# EasyEDA Pro project ProPrj_STM32SmartWatch.epro

# Schematic Schematic1
Board Name: Board1; Create Date: 2026-09-27; Page Name: P1; Project Name: STM32SmartWatch_2026-09-27_17-07-18; Schematic Name: Schematic1; Update Date: 2026-10-04; Company: 嘉立创EDA; Page Size: A4; Version: V1.0
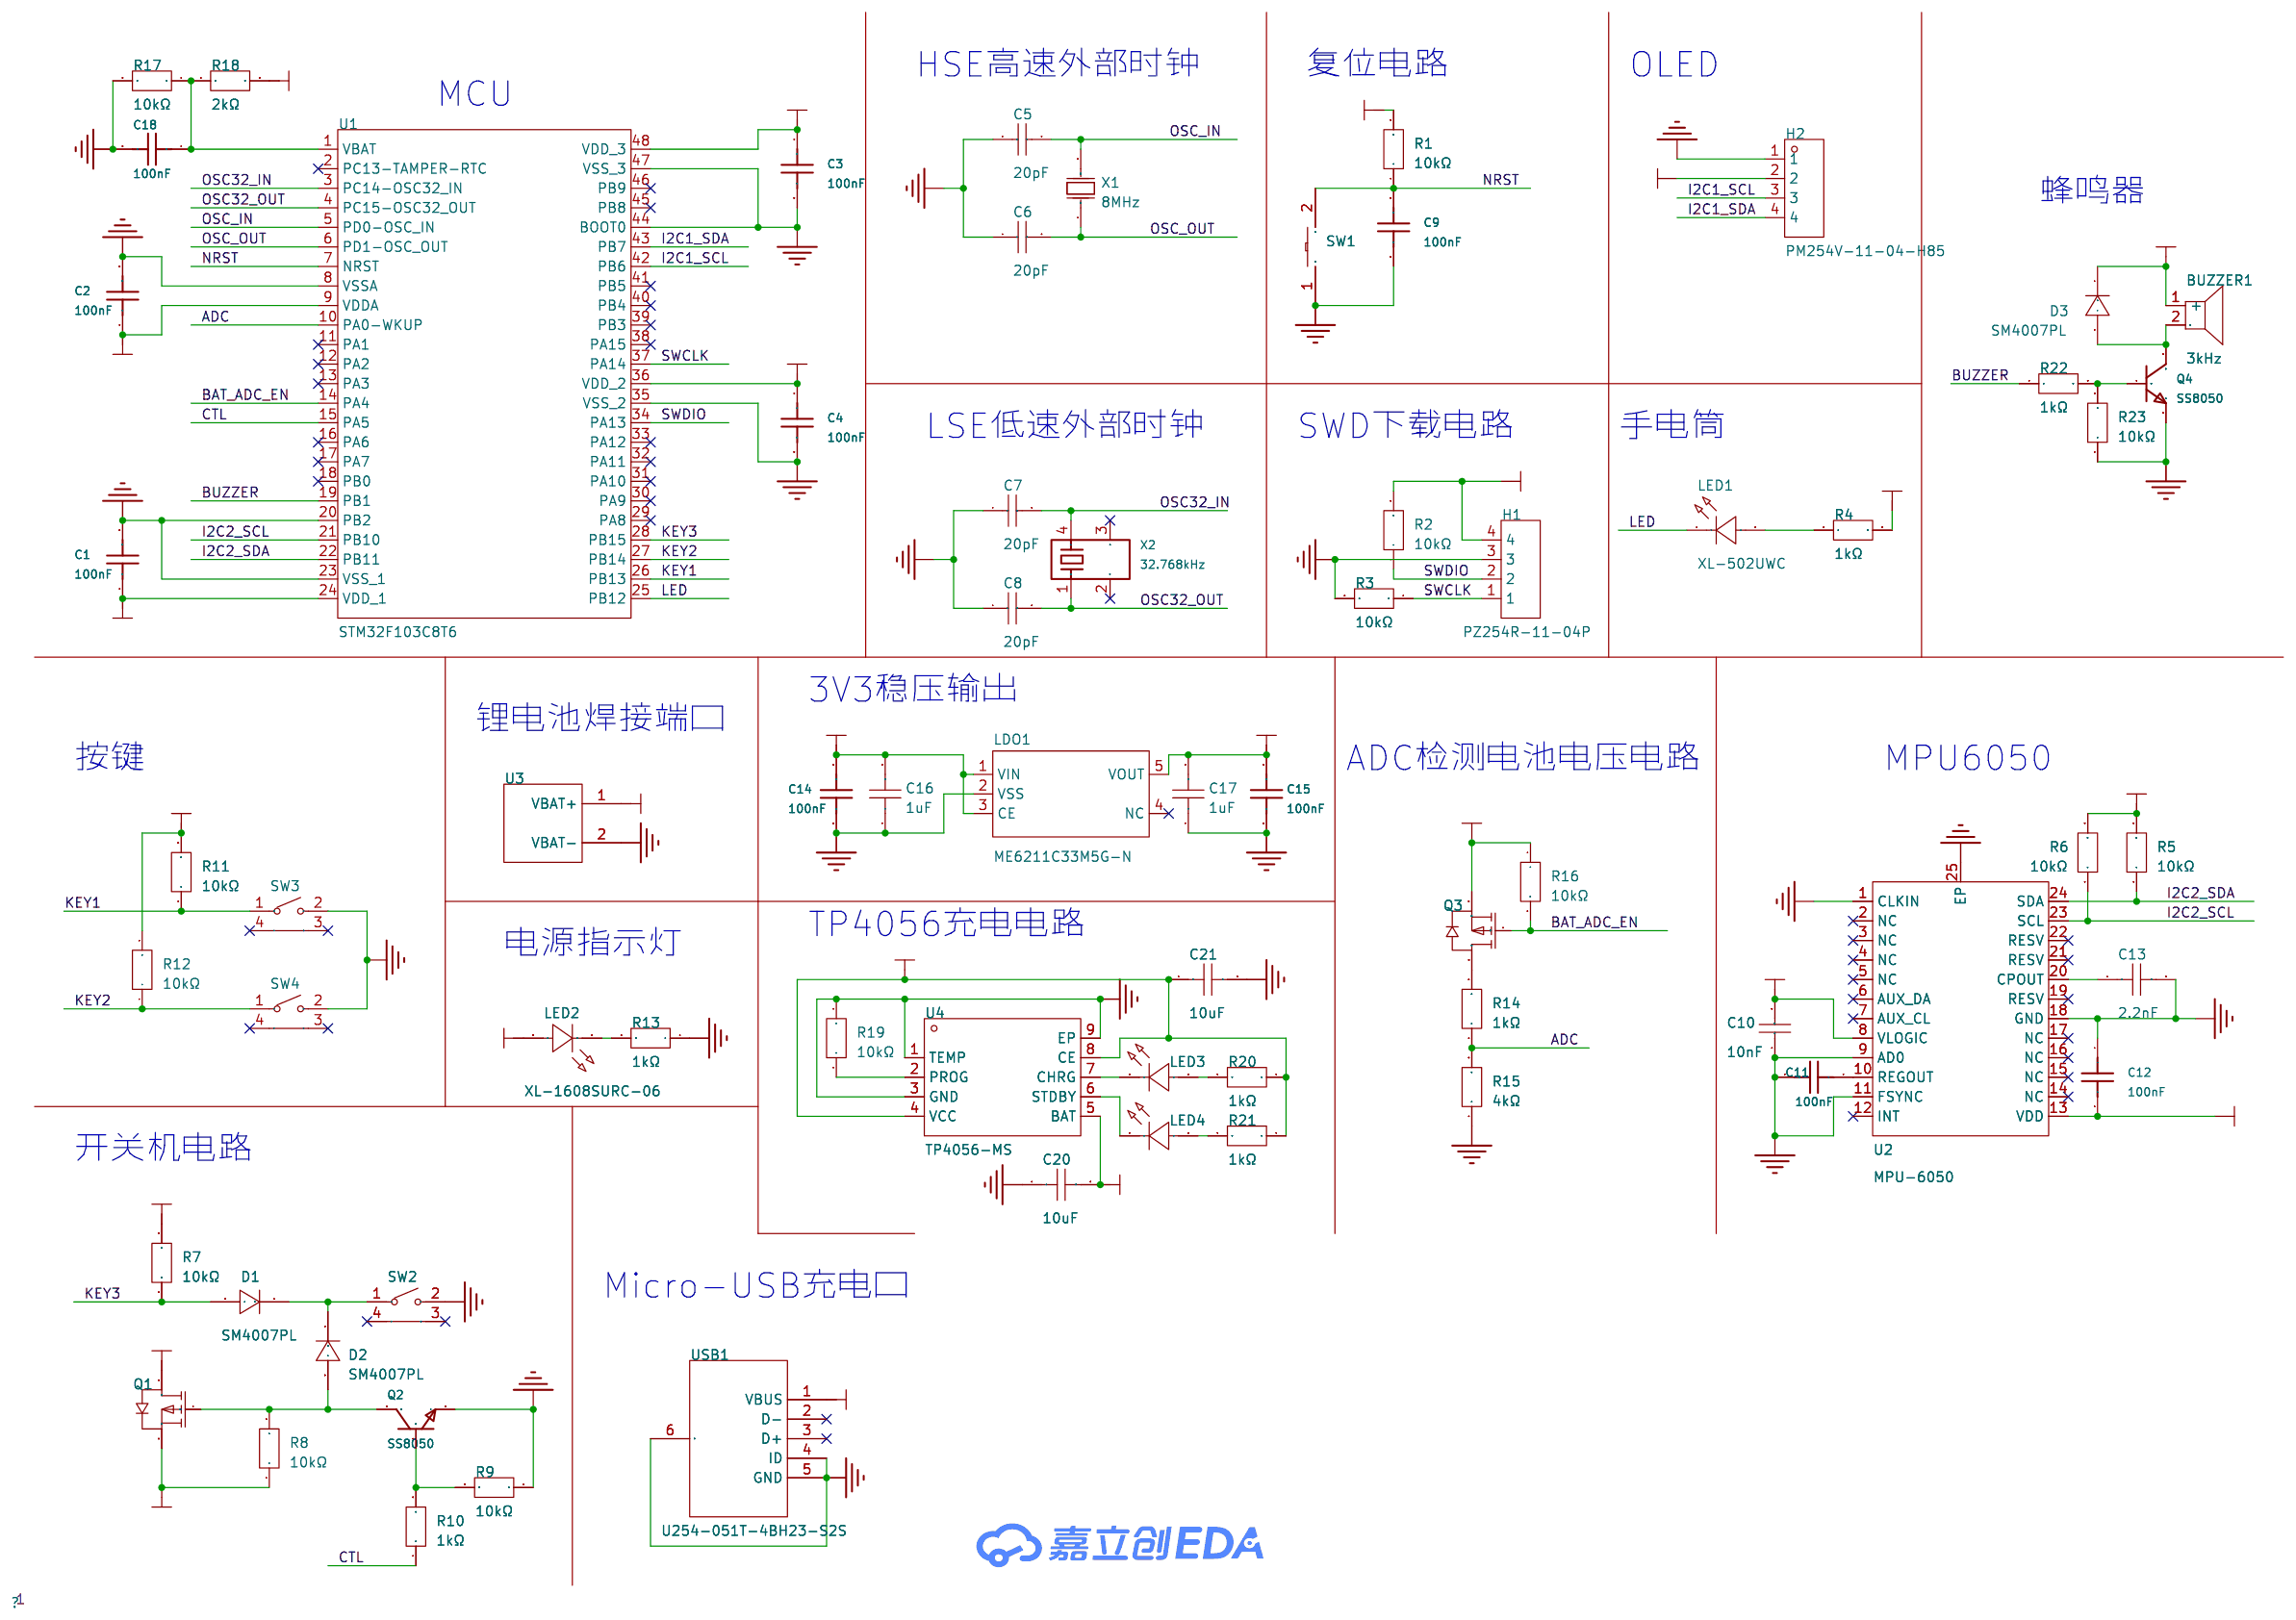
[diagram p0: schematic sheet]

## Parts
BUZZER1  3kHz  [BUZ-TH_BD9.6-P5.00-D0.7-FD]
C1  100nF  [C0603]
C2  100nF  [C0603]
C3  100nF  [C0603]
C4  100nF  [C0603]
C5  20pF  [C0603]
C6  20pF  [C0603]
C7  20pF  [C0603]
C8  20pF  [C0603]
C9  100nF  [C0603]
C10  10nF  [C0603]
C11  100nF  [C0603]
C12  100nF  [C0603]
C13  2.2nF  [C0603]
C14  100nF  [C0603]
C15  100nF  [C0603]
C16  1uF  [C0603]
C17  1uF  [C0603]
C18  100nF  [C0603]
C20  10uF  [C0603]
C21  10uF  [C0603]
D1  SM4007PL  [SOD-123F_L2.8-W1.8-LS3.7-RD]
D2  SM4007PL  [SOD-123F_L2.8-W1.8-LS3.7-RD]
D3  SM4007PL  [SOD-123F_L2.8-W1.8-LS3.7-RD]
H1  PZ254R-11-04P  [HDR-TH_4P-P2.54-H-M-W10.4]
H2  PM254V-11-04-H85  [HDR-TH_4P-P2.54-V-F]
LDO1  ME6211C33M5G-N  [SOT-23-5_L3.0-W1.7-P0.95-LS2.8-BL]
LED1  XL-502UWC  [LED-TH_BD5.9-P2.54-RD_WHITE]
LED2  XL-1608SURC-06  [LED0603-RD_RED]
LED3  XL-1608SURC-06  [LED0603-RD_RED]
LED4  XL-1608PGC-06  [LED0603-RD_GREEN]
Q1  SI2301CDS-T1-GE3  [SOT-23-3_L3.0-W1.7-P0.95-LS2.9-BR]
Q2  SS8050  [SOT-23-3_L2.9-W1.3-P1.90-LS2.4-BR]
Q3  SI2301CDS-T1-GE3  [SOT-23-3_L3.0-W1.7-P0.95-LS2.9-BR]
Q4  SS8050  [SOT-23-3_L2.9-W1.3-P1.90-LS2.4-BR]
R1  10kΩ  [R0603]
R2  10kΩ  [R0603]
R3  10kΩ  [R0603]
R4  1kΩ  [R0603]
R5  10kΩ  [R0603]
R6  10kΩ  [R0603]
R7  10kΩ  [R0603]
R8  10kΩ  [R0603]
R9  10kΩ  [R0603]
R10  1kΩ  [R0603]
R11  10kΩ  [R0603]
R12  10kΩ  [R0603]
R13  1kΩ  [R0603]
R14  1kΩ  [R0603]
R15  4kΩ  [R0603]
R16  10kΩ  [R0603]
R17  10kΩ  [R0603]
R18  2kΩ  [R0603]
R19  10kΩ  [R0603]
R20  1kΩ  [R0603]
R21  1kΩ  [R0603]
R22  1kΩ  [R0603]
R23  10kΩ  [R0603]
SW1  TS-1101-C-W  [SW-SMD_L6.0-W3.3-LS8.0_TS-1101-C-W]
SW2  GT-TC018A-H0375-L1  [SW-SMD_L4.7-W3.5-P3.35-EH]
SW3  GT-TC018A-H0375-L1  [SW-SMD_L4.7-W3.5-P3.35-EH]
SW4  GT-TC018A-H0375-L1  [SW-SMD_L4.7-W3.5-P3.35-EH]
U1  STM32F103C8T6  [LQFP-48_L7.0-W7.0-P0.50-LS9.0-BL]
U2  MPU-6050  [QFN-24_L4.0-W4.0-P0.50-BL-EP2.7]
U3  -  [302530BAT]
U4  TP4056-MS  [SOP-8_L4.9-W3.9-P1.27-LS6.0-TL-EP]
USB1  U254-051T-4BH23-S2S  [MICRO-USB-SMD_U254-051T-4BH23-S2S]
X1  8MHz  [CRYSTAL-SMD_L5.0-W3.2]
X2  32.768kHz  [MC-306_4P-L8.0-W3.2-P5.5-BL]

## Library data of the parts
BUZZER1 = HNB09A05: 驱动方式:有源(内含驱动线路);构造类型:电磁式;额定电压:5V;频率:3kHz;声压(SPL):85dB;; LCSC Part Name: 有源(内含驱动线路) 电磁式 3kHz; Supplier Part: C96493; Manufacturer: 华能; Supplier Footprint: 插件,D=9mm; JLCPCB Part Class: 扩展库; Datasheet: https://item.szlcsc.com/datasheet/HNB09A05/97698.html; Supplier: LCSC; Driver Circuitry: 有源(内含驱动线路); Technology: 电磁式; Voltage Rating: 5V; Voltage - Supply: 3V~7V; Current Consumption: 30mA; Sound Pressure Level(SPL): 85dB; Diameter(φD): 9mm; Height: 5.7mm; Operating Temperature: -20℃~+70℃; Mounting Type: 插件
C1-C4 C9 C11 C12 C14 C15 C18 = CC0603KRX7R9BB104: 容值:100nF;精度:±10%;额定电压:50V;温度系数:X7R;; LCSC Part Name: 100nF ±10% 50V; Supplier Part: C14663; Manufacturer: YAGEO(国巨); Supplier Footprint: 0603; JLCPCB Part Class: 基础库; Datasheet: https://item.szlcsc.com/datasheet/CC0603KRX7R9BB104/15331.html; Supplier: LCSC; Tolerance: ±10%; Voltage Rating: 50V; Temperature Coefficient: X7R
C5-C8 = CL10C200JB8NNNC: 容值:20pF;精度:±5%;额定电压:50V;温度系数:C0G;; LCSC Part Name: 20pF ±5% 50V; Supplier Part: C1648; Manufacturer: SAMSUNG(三星); Supplier Footprint: 0603; JLCPCB Part Class: 基础库; Datasheet: https://item.szlcsc.com/datasheet/CL10C200JB8NNNC/2000.html; Supplier: LCSC; Tolerance: ±5%; Voltage Rating: 50V; Temperature Coefficient: C0G
C10 = CC0603KRX7R9BB103: 容值:10nF;精度:±10%;额定电压:50V;温度系数:X7R;; LCSC Part Name: 10nF ±10% 50V; Supplier Part: C100042; Manufacturer: YAGEO(国巨); Supplier Footprint: 0603; JLCPCB Part Class: 扩展库; Datasheet: https://item.szlcsc.com/datasheet/CC0603KRX7R9BB103/101256.html; Supplier: LCSC; Tolerance: ±10%; Voltage Rating: 50V; Temperature Coefficient: X7R
C13 = FCC0603B222K500CT: 容值:2.2nF;精度:±10%;额定电压:50V;温度系数:X7R;; LCSC Part Name: 2.2nF ±10% 50V; Supplier Part: C5137562; Manufacturer: FOJAN(富捷); Supplier Footprint: 0603; JLCPCB Part Class: 扩展库; Datasheet: https://item.szlcsc.com/datasheet/FCC0603B222K500CT/5747014.html; Supplier: LCSC; Tolerance: ±10%; Voltage Rating: 50V; Temperature Coefficient: X7R; Operating Temperature: -55℃~+125℃
C16 C17 = CL10A105KB8NNNC: 容值:1uF;精度:±10%;额定电压:50V;温度系数:X5R;; LCSC Part Name: 1uF ±10% 50V; Supplier Part: C15849; Manufacturer: SAMSUNG(三星); Supplier Footprint: 0603; JLCPCB Part Class: 基础库; Datasheet: https://item.szlcsc.com/datasheet/CL10A105KB8NNNC/16531.html; Supplier: LCSC; Tolerance: ±10%; Voltage Rating: 50V; Temperature Coefficient: X5R
C20 C21 = CL10A106KP8NNNC: 容值:10uF;精度:±10%;额定电压:10V;温度系数:X5R;; LCSC Part Name: 10uF ±10% 10V; Supplier Part: C19702; Manufacturer: SAMSUNG(三星); Supplier Footprint: 0603; JLCPCB Part Class: 基础库; Datasheet: https://item.szlcsc.com/datasheet/CL10A106KP8NNNC/20411.html; Supplier: LCSC; Tolerance: ±10%; Voltage Rating: 10V; Temperature Coefficient: X5R
D1-D3 = SM4007PL_C64898: 二极管配置:独立式;正向压降(Vf):1.1V@1A;直流反向耐压(Vr):1kV;整流电流:1A;; LCSC Part Name: 1kV 1A; Supplier Part: C64898; Manufacturer: MDD(辰达半导体); Supplier Footprint: SOD-123FL; JLCPCB Part Class: 基础库; Datasheet: https://item.szlcsc.com/datasheet/SM4007PL/65968.html; Supplier: LCSC; Diode Configuration: 独立式; Voltage - Forward(Vf@If): 1.1V@1A; Voltage - DC Reverse(Vr): 1kV; Current - Rectified: 1A; Reverse Leakage Current (Ir): 10uA@1kV; Non-Repetitive Peak Forward Surge Current: 25A; Operating Junction Temperature Range: -55℃~+150℃
H1 = PZ254R-11-04P: 插针结构:1x4P;间距:2.54mm;行距:-;圆针/方针:方针;安装方式:弯插;排数:单排;总PIN位数:4P;额定电流:3A;额定电压:250V;配合针长度:6mm;塑高:2.5mm;端接针长度:-;触头材质:黄铜;触头镀层:-;工作温度:-40℃~+105℃;颜色:黑色;; LCSC Part Name: 1x4P 间距:2.54mm 方针 弯插; Supplier Part: C492412; Manufacturer: XFCN(兴飞); Supplier Footprint: 弯插,P=2.54mm; JLCPCB Part Class: 扩展库; Datasheet: https://item.szlcsc.com/datasheet/PZ254R-11-04P/502968.html; Supplier: LCSC; Pin Structure: 1x4P; Pitch: 2.54mm; Circluar Pins/Square Pins: 方针; Mounting Type: 弯插; Number of Rows: 单排; Number of Pins: 4P; Current Rating: 3A; Voltage Rating (Max): 250V; Length of Mating Pin: 6mm; Insulation Height: 2.5mm; Contact Material: 黄铜; Operating Temperature: -40℃~+105℃; Color: 黑色
H2 = PM254V-11-04-H85: 插孔结构:1x4P;间距:2.54mm;行距:-;圆孔/方孔:方孔;安装方式:直插;排数:单排;总孔位数:4P;额定电流:3A;额定电压:250V;插孔方向:顶部;塑高:8.5mm;触头材质:黄铜;触头镀层:金;工作温度:-40℃~+105℃;; LCSC Part Name: 1x4P 间距:2.54mm 直插; Supplier Part: C541851; Manufacturer: XFCN(兴飞); Supplier Footprint: 插件,P=2.54mm; JLCPCB Part Class: 扩展库; Datasheet: https://item.szlcsc.com/datasheet/PM254V-11-04-H85/562472.html; Supplier: LCSC; Holes Structure: 1x4P; Pitch: 2.54mm; Circular Hole / Square Hole: 方孔; Mounting Type: 直插; Number of Rows: 单排; Number of Positions: 4P; Current Rating: 3A; Voltage Rating (Max): 250V; Holes Direction: 顶部; Insulation Height: 8.5mm; Contact Material: 黄铜; Contact Plating: 金; Operating Temperature: -40℃~+105℃; PIN Length: 3.2mm
LDO1 = ME6211C33M5G-N: 输出极性:正极;工作电压:6V;输出电压:3.3V;输出电流:500mA;电源纹波抑制比(PSRR):70dB@(1kHz);输出类型:固定;; LCSC Part Name: 3.3V 500mA 6V; Supplier Part: C82942; Manufacturer: MICRONE(南京微盟); Supplier Footprint: SOT-23-5; JLCPCB Part Class: 扩展库; Datasheet: https://item.szlcsc.com/datasheet/ME6211C33M5G-N/84106.html; Supplier: LCSC; Output Configuration: 正极; Voltage - Supply: 6V; Output Voltage: 3.3V; Output Current: 500mA; Power Supply Rejection Ratio (PSRR): 70dB@(1kHz); Voltage Dropout: 120mV@(100mA); standby current: 60uA; Noise: 50uVrms; Features: 使能控制；短路保护；过流保护; Operating Temperature: -40℃~+150℃; Output Type: 固定; Number of Outputs: 1
LED1 = XL-502UWC: 灯头类型:5mm圆形灯头;发光颜色:白色;正向压降(Vf):3.3V;功率:70mW;测试电流:20mA;波长:-;二极管配置:独立二极管;透镜颜色:无色透明透镜;色温:9000K~20000K;发光强度:20cd;发光角度:30°;载带方式:-;工作温度:-25℃~+85℃;; LCSC Part Name: F5白发白短脚; Supplier Part: C2895480; Manufacturer: XINGLIGHT(成兴光); Supplier Footprint: 插件,D=5mm; JLCPCB Part Class: 扩展库; Datasheet: https://item.szlcsc.com/datasheet/XL-502UWC/3136195.html; Supplier: LCSC; Lamp Holder Type: 5mm圆形灯头; Illumination Color: 白色; Voltage - Forward(Vf): 3.3V; Power(Watts): 70mW; Test Current: 20mA; Diode Configuration: 独立二极管; Lens Color: 无色透明透镜; Color Temperature: 9000K~20000K; Luminous Intensity: 20cd; Viewing Angle: 30°; Operating Temperature: -25℃~+85℃
LED2 LED3 = XL-1608SURC-06: 灯头类型:1.6mmx0.8mm方形灯头;发光颜色:红色;正向压降(Vf):2.3V;功率:50mW;正向电流:20mA;波长:620nm~630nm;二极管配置:独立二极管;透镜颜色:无色透明透镜;色温:-;发光强度:225mcd;发光角度:120°;载带方式:正贴;工作温度:-40℃~+85℃;; LCSC Part Name: 0603红色贴片式发光二极管; Supplier Part: C965799; Manufacturer: XINGLIGHT(成兴光); Supplier Footprint: 0603; JLCPCB Part Class: 扩展库; Datasheet: https://item.szlcsc.com/datasheet/XL-1608SURC-06/1051408.html; Supplier: LCSC; Lamp Holder Type: 1.6mmx0.8mm方形灯头; Illumination Color: 红色; Voltage - Forward(Vf): 2.3V; Power(Watts): 50mW; Forward Current: 20mA; Wavelength - Dominant: 620nm~630nm; Peak Wavelength: 625nm; Diode Configuration: 独立二极管; Lens Color: 无色透明透镜; Luminous Intensity: 225mcd; Viewing Angle: 120°; Mounting Style: 正贴; Operating Temperature: -40℃~+85℃
LED4 = XL-1608PGC-06: 灯头类型:1.6mmx0.8mm方形灯头;发光颜色:翠绿色;正向压降(Vf):2.6V~3V;功率:75mW;正向电流:30mA;波长:515nm~530nm;二极管配置:独立二极管;透镜颜色:绿色透镜;色温:-;发光强度:900mcd;发光角度:120°;载带方式:正贴;工作温度:-20℃~+85℃;; LCSC Part Name: 0603加粉翠绿0.6T贴片式发光二极管; Supplier Part: C7371905; Manufacturer: XINGLIGHT(成兴光); Supplier Footprint: 0603; JLCPCB Part Class: 扩展库; Datasheet: https://item.szlcsc.com/datasheet/XL-1608PGC-06/8342977.html; Supplier: LCSC; Lamp Holder Type: 1.6mmx0.8mm方形灯头; Illumination Color: 翠绿色; Voltage - Forward(Vf): 2.6V~3V; Power(Watts): 75mW; Forward Current: 30mA; Wavelength - Dominant: 515nm~530nm; Peak Wavelength: 525nm; Diode Configuration: 独立二极管; Lens Color: 绿色透镜; Luminous Intensity: 900mcd; Viewing Angle: 120°; Mounting Style: 正贴; Operating Temperature: -20℃~+85℃
Q1 Q3 = SI2301CDS-T1-GE3: 数量:1个P沟道;漏源电压(Vdss):20V;连续漏极电流(Id):3.1A;导通电阻(RDS(on)):142mΩ@2.5V;耗散功率(Pd):1.6W;阈值电压(Vgs(th)):1V;; LCSC Part Name: 1个P沟道 耐压:20V 电流:3.1A; Supplier Part: C10487; Manufacturer: VISHAY(威世); Supplier Footprint: SOT-23; JLCPCB Part Class: 基础库; Datasheet: https://item.szlcsc.com/datasheet/SI2301CDS-T1-GE3/11030.html; Supplier: LCSC; Number: 1个P沟道; Drain to Source Voltage: 20V; Current - Continuous Drain(Id): 3.1A; RDS(on): 142mΩ@2.5V; Pd - Power Dissipation: 1.6W; Gate Threshold Voltage (Vgs(th)): 1V; Gate Charge(Qg): 10nC@4.5V; Input Capacitance(Ciss): 405pF; Reverse Transfer Capacitance (Crss@Vds): 55pF; Operating Temperature: -55℃~+150℃; Type: P沟道; Output Capacitance(Coss): 75pF; Vgs: ±8V
Q2 Q4 = SS8050_C7420370: 晶体管类型:NPN;集电极电流(Ic):1.5A;集射极击穿电压(Vceo):25V;耗散功率(Pd):300mW;直流电流增益(hFE):120;; LCSC Part Name: H档 200-350 NPN 电流:1.5A 电压:25V; Supplier Part: C7420370; Manufacturer: R+O(宏嘉诚); Supplier Footprint: SOT-23; JLCPCB Part Class: 扩展库; Datasheet: https://item.szlcsc.com/datasheet/SS8050/8397192.html; Supplier: LCSC; type: NPN; Current - Collector(Ic): 1.5A; Collector - Emitter Voltage VCEO: 25V; Pd - Power Dissipation: 300mW; DC Current Gain: 120; Transition frequency(fT): 100MHz; Current - Collector Cutoff: 100nA; Vce Saturation(VCE(sat)): 500mV; Operating Temperature: -55℃~+150℃; Emitter-Base Voltage(Vebo): 5V; Number: 1个NPN; Configuration: 独立式
R1-R3 R5-R9 R11 R12 R16 R17 R19 R23 = FRC0603J103 TS: 电阻类型:厚膜电阻;阻值:10kΩ;精度:±5%;功率:100mW;工作电压:75V;温度系数:±100ppm/℃;; LCSC Part Name: 10kΩ ±5% 100mW 厚膜电阻; Supplier Part: C2930027; Manufacturer: FOJAN(富捷); Supplier Footprint: 0603; JLCPCB Part Class: 扩展库; Datasheet: https://item.szlcsc.com/datasheet/FRC0603J103%2520TS/3266960.html; Supplier: LCSC; Type: 厚膜电阻; Tolerance: ±5%; Power(Watts): 100mW; Voltage-Supply(Max): 75V; Temperature Coefficient: ±100ppm/℃; Operating Temperature: -55℃~+155℃
R4 R10 R13 R14 R20-R22 = FRC0603F1001TS: 电阻类型:厚膜电阻;阻值:1kΩ;精度:±1%;功率:100mW;工作电压:75V;温度系数:±100ppm/℃;; LCSC Part Name: 1kΩ ±1% 100mW 厚膜电阻; Supplier Part: C2907002; Manufacturer: FOJAN(富捷); Supplier Footprint: 0603; JLCPCB Part Class: 扩展库; Datasheet: https://item.szlcsc.com/datasheet/FRC0603F1001TS/3180515.html; Supplier: LCSC; Type: 厚膜电阻; Tolerance: ±1%; Power(Watts): 100mW; Voltage-Supply(Max): 75V; Temperature Coefficient: ±100ppm/℃; Operating Temperature: -55℃~+155℃
R15 = ARG03FTC4001N: 电阻类型:薄膜电阻;阻值:4kΩ;精度:±1%;功率:100mW;工作电压:75V;温度系数:±25ppm/℃;; LCSC Part Name: 薄膜电阻 4kΩ ±1% 100mW; Supplier Part: C2984443; Manufacturer: Viking(光颉); Supplier Footprint: 0603; JLCPCB Part Class: 扩展库; Datasheet: https://item.szlcsc.com/datasheet/ARG03FTC4001N/3425978.html; Supplier: LCSC; Type: 薄膜电阻; Tolerance: ±1%; Power(Watts): 100mW; Voltage-Supply(Max): 75V; Temperature Coefficient: ±25ppm/℃; Operating Temperature: -55℃~+155℃
R18 = FRC0603J202 TS: 电阻类型:厚膜电阻;阻值:2kΩ;精度:±5%;功率:100mW;工作电压:75V;温度系数:±100ppm/℃;; LCSC Part Name: 2kΩ ±5% 100mW 厚膜电阻; Supplier Part: C2907137; Manufacturer: FOJAN(富捷); Supplier Footprint: 0603; JLCPCB Part Class: 扩展库; Supplier: LCSC; Type: 厚膜电阻; Tolerance: ±5%; Power(Watts): 100mW; Voltage-Supply(Max): 75V; Temperature Coefficient: ±100ppm/℃; Operating Temperature: -55℃~+155℃
SW1 = TS-1101-C-W: 电路结构:单刀单掷;按钮形状:矩形按钮;作用力:2.6N;安装方式:立贴;开关长度:6mm;开关宽度:3.6mm;开关高度:2.5mm;带支架:不带支架;触点电流:50mA;额定电压:12V;带灯:无;工作寿命:5万次;; LCSC Part Name: 6*3.6*2.5mm 立贴 轻触开关; Supplier Part: C318938; Manufacturer: XKB Connection(中国星坤); Supplier Footprint: SMD,6x3.6mm; JLCPCB Part Class: 扩展库; Datasheet: https://item.szlcsc.com/datasheet/TS-1101-C-W/300030.html; Supplier: LCSC; Circuit: 单刀单掷; Actuator Style: 矩形按钮; Operating Force: 2.6N; Mounting Type: 立贴; Length: 6mm; Width: 3.6mm; Switch Height: 2.5mm; with Bracket: 不带支架; Contact Current: 50mA; Voltage Rating: 12V; With Lamp: 无; Life: 5万次; Operating Temperature: -30℃~+85℃
SW2-SW4 = GT-TC018A-H0375-L1: 电路结构:单刀单掷;按钮形状:矩形按钮;作用力:1.6N;安装方式:卧贴;开关长度:4.7mm;开关宽度:1.9mm;开关高度:3.75mm;带支架:带支架;触点电流:50mA;额定电压:12V;带灯:无;工作寿命:10万次;; LCSC Part Name: 4.7*1.9*3.75mm 卧贴 轻触开关; Supplier Part: C963235; Manufacturer: G-Switch(品赞); Supplier Footprint: SMD,4.7x1.9mm; JLCPCB Part Class: 扩展库; Datasheet: https://item.szlcsc.com/datasheet/GT-TC018A-H0375-L1/1046870.html; Supplier: LCSC; Circuit: 单刀单掷; Actuator Style: 矩形按钮; Operating Force: 1.6N; Mounting Type: 卧贴; Length: 4.7mm; Width: 1.9mm; Switch Height: 3.75mm; with Bracket: 带支架; Contact Current: 50mA; Voltage Rating: 12V; Actuator/Cap Color: 黑色; With Lamp: 无; Termination Style: SMD接片; Life: 10万次; Operating Temperature: -30℃~+85℃
U1 = STM32F103C8T6: CPU内核:ARM Cortex-M3;CPU最大主频:72MHz;CPU位数:32 Bit;; LCSC Part Name: 主流增强型ARM Cortex-M3 MCU，具有64 KB Flash、72 MHz CPU、电机控制、USB和CAN; Supplier Part: C8734; Manufacturer: ST(意法半导体); Supplier Footprint: LQFP-48(7x7); JLCPCB Part Class: 扩展库; Datasheet: https://item.szlcsc.com/datasheet/STM32F103C8T6/9243.html; Supplier: LCSC; CPU Core: ARM Cortex-M3; CPU Maximum Speed: 72MHz; Core Size: 32 Bit; Program Storage Size: 64KB; Program Memory Type: FLASH; RAM Size: 20KB; Number of I/O: 37; ADC (Bit): 12bit; Oscillator Type: 内置; Voltage - Supply: 2V~3.6V; Operating Temperature: -40℃~+85℃
U2 = MPU-6050: 传感器类型:IMU(加速度计+陀螺仪);接口类型:I2C;; Supplier Part: C24112; Manufacturer: TDK InvenSense(应美盛); Supplier Footprint: QFN-24-EP(4x4); JLCPCB Part Class: 扩展库; Datasheet: https://item.szlcsc.com/datasheet/MPU-6050/24852.html; Supplier: LCSC; Accelerometer Sensing Axis: X,Y,Z; Acceleration Measurement Range (MAX): ±16g; Gyroscope Sensing Axis: X,Y,Z; Gyroscope Measurement Range (MAX): ±2000dps; Sensor Type: IMU(加速度计+陀螺仪); Output Bits: 16bit; Interface: I2C; Voltage - Supply: 2.375V~3.46V; Cache Size: 1KB; Standby Current: 5uA; Operating Temperature: -40℃~+85℃; Features: 运动事件检测；同步与时间戳
U3 = 302530BAT
U4 = TP4056-MS: 工作电压:4.2V~5.5V;最大充电电流:1A;电池类型:锂电池;电池节数:1;; LCSC Part Name: 单节锂离子电池充电器; Supplier Part: C7473158; Manufacturer: MSKSEMI(美森科); Supplier Footprint: SOP-8-EP; JLCPCB Part Class: 扩展库; Datasheet: https://item.szlcsc.com/datasheet/TP4056-MS/8533532.html; Supplier: LCSC; The Chip Type: 充电芯片; Voltage - Supply: 4.2V~5.5V; Charge Current - Max: 1A; Charging Saturation Voltage: 4.2V; Type of Battery: 锂电池; Number of Cells: 1; Operating Temperature: -40℃~+85℃; Battery Temperature Detection: 支持; Supply Current (Iq): 70uA; Features: 恒压充电；恒流充电；自动再充电；充电终止；软启动；可编程充电电流；欠压锁定；涓流充电
USB1 = U254-051T-4BH23-S2S: 连接器类型:Micro-B;协议标准:-;公母:母;安装方式:卧贴;触点数量:5P;端口数量:1;额定电流 - 电源:1.8A;工作温度:-40℃~+85℃;; LCSC Part Name: Micro-B 母 卧贴; Supplier Part: C482361; Manufacturer: XKB Connection(中国星坤); Supplier Footprint: SMD; JLCPCB Part Class: 扩展库; Datasheet: https://item.szlcsc.com/datasheet/U254-051T-4BH23-S2S/490287.html; Supplier: LCSC; Connector Type: Micro-B; Gender: 母; Mounting Type: 卧贴; Number of Contacts: 5P; Number of Ports: 1; Current Rating-Power: 1.8A; Voltage Rating: 30V; Connect-Disconnect Life: 1万次; Length: 5.2mm; Detection color: 黑色; Operating Temperature: -40℃~+85℃
X1 = X50328MSB2GI: 晶振类型:贴片晶振;频率:8MHz;常温频差:±10ppm;负载电容:20pF;频率稳定度:±20ppm;; LCSC Part Name: YSX530GA 8MHZ 2P 5032 20PF ±10PPM -40~85℃ (±20PPM); Supplier Part: C115962; Manufacturer: YXC(扬兴晶振); Supplier Footprint: SMD5032-2P; JLCPCB Part Class: 基础库; Datasheet: https://item.szlcsc.com/datasheet/X50328MSB2GI/117214.html; Supplier: LCSC; Type: 贴片晶振; Normal temperature Frequency Tolerance: ±10ppm; Load Capacitance: 20pF; Frequency Stability: ±20ppm; Equivalent Series Resistance(ESR): 80Ω; Operating Temperature: -40℃~+85℃
X2 = Q13MC30610003: 晶振类型:贴片晶振;频率:32.768kHz;常温频差:±20ppm;负载电容:12.5pF;; LCSC Part Name: 32.768kHz ±20ppm 12.5pF; Supplier Part: C16320; Manufacturer: EPSON(爱普生); Supplier Footprint: MC-306; JLCPCB Part Class: 扩展库; Datasheet: https://item.szlcsc.com/datasheet/Q13MC30610003/17002.html; Supplier: LCSC; Type: 贴片晶振; Normal temperature Frequency Tolerance: ±20ppm; Load Capacitance: 12.5pF; Equivalent Series Resistance(ESR): 35kΩ; Operating Temperature: -40℃~+85℃

## Nets
3V3: BUZZER1.1(+) C1.1 C2.1 C3.1 C4.1 C10.2 C12.2 C15.1 C17.2 D3.1(C) H1.4 H2.2 LDO1.5(VOUT) LED2.2(A) R1.2 R2.2 R4.2 R5.2 R6.2 R7.2 R11.2 R12.2 U1.9(VDDA) U1.24(VDD_1) U1.36(VDD_2) U1.48(VDD_3) U2.8(VLOGIC) U2.13(VDD)
+5V: C21.1 R20.1 R21.1 U4.4(VCC) U4.8(CE) USB1.1(VBUS)
GND: C1.2 C2.2 C3.2 C4.2 C5.1 C6.1 C7.1 C8.1 C9.2 C10.1 C11.2 C12.1 C13.2 C14.2 C15.2 C16.1 C17.1 C18.2 C20.1 C21.2 H1.3 H2.1 LDO1.2(VSS) Q2.2(E) Q4.2(E) R3.2 R9.1 R13.1 R15.1 R17.2 R19.1 R23.1 SW1.1 SW2.2 SW3.2 SW4.2 U1.8(VSSA) U1.20(PB2) U1.23(VSS_1) U1.35(VSS_2) U1.44(BOOT0) U1.47(VSS_3) U2.1(CLKIN) U2.9(AD0) U2.11(FSYNC) U2.18(GND) U2.25(EP) U3.2(VBAT-) U4.1(TEMP) U4.3(GND) U4.9(EP) USB1.4(ID) USB1.5(GND) USB1.6(EH)
VBAT: C14.1 C16.2 LDO1.1(VIN) LDO1.3(CE) Q1.3(D)
VBAT+: C20.2 Q1.2(S) Q3.2(S) R8.1 R16.1 R18.2 U3.1(VBAT+) U4.5(BAT)
ADC: R14.1 R15.2 U1.10(PA0-WKUP)
BAT_ADC_EN: Q3.1(G) R16.2 U1.14(PA4)
BUZZER: R22.1 U1.19(PB1)
CTL: R10.1 U1.15(PA5)
I2C1_SCL: H2.3 U1.42(PB6)
I2C1_SDA: H2.4 U1.43(PB7)
I2C2_SCL: R6.1 U1.21(PB10) U2.23(SCL)
I2C2_SDA: R5.1 U1.22(PB11) U2.24(SDA)
KEY1: R11.1 SW3.1 U1.26(PB13)
KEY2: R12.1 SW4.1 U1.27(PB14)
KEY3: D1.2(A) R7.1 U1.28(PB15)
LED: LED1.1(K) U1.25(PB12)
NRST: C9.1 R1.1 SW1.2 U1.7(NRST)
OSC32_IN: C7.2 U1.3(PC14-OSC32_IN) X2.4
OSC32_OUT: C8.2 U1.4(PC15-OSC32_OUT) X2.1
OSC_IN: C5.2 U1.5(PD0-OSC_IN) X1.2(OSC2)
OSC_OUT: C6.2 U1.6(PD1-OSC_OUT) X1.1(OSC1)
SWCLK: H1.1 R3.1 U1.37(PA14)
SWDIO: H1.2 R2.1 U1.34(PA13)
$1N2713: LED1.2(A) R4.1
$1N4061: C11.1 U2.10(REGOUT)
$1N4275: C13.1 U2.20(CPOUT)
$1N5916: D1.1(C) D2.1(C) SW2.1
$1N5939: D2.2(A) Q1.1(G) Q2.3(C) R8.2
$1N6231: Q2.1(B) R9.2 R10.2
$1N7170: LED2.1(K) R13.2
$1N7264: Q3.3(D) R14.2
$1N7605: C18.1 R17.1 R18.1 U1.1(VBAT)
$1N8107: R19.2 U4.2(PROG)
$1N8262: LED3.1(K) U4.7(CHRG)
$1N8264: LED3.2(A) R20.2
$1N8386: LED4.1(K) U4.6(STDBY)
$1N8609: LED4.2(A) R21.2
$1N8968: BUZZER1.2 D3.2(A) Q4.3(C)
$1N9028: Q4.1(B) R22.2 R23.2

Not connected (* = marked no-connect by the designer): LDO1 4(NC)*; SW2 3* 4*; SW3 3* 4*; SW4 3* 4*; U1 2(PC13-TAMPER-RTC)* 11(PA1)* 12(PA2)* 13(PA3)* 16(PA6)* 17(PA7)* 18(PB0)* 29(PA8)* 30(PA9)* 31(PA10)* 32(PA11)* 33(PA12)* 38(PA15)* 39(PB3)* 40(PB4)* 41(PB5)* 45(PB8)* 46(PB9)*; U2 2(NC)* 3(NC)* 4(NC)* 5(NC)* 6(AUX_DA)* 7(AUX_CL)* 12(INT)* 14(NC)* 15(NC)* 16(NC)* 17(NC)* 19(RESV)* 21(RESV)* 22(RESV)*; USB1 2(D-)* 3(D+)*; X2 2* 3*

## Notes on the sheet
- HSE高速外部时钟
- 复位电路
- OLED
- MCU
- 蜂鸣器
- LSE低速外部时钟
- SWD下载电路
- 手电筒
- 3V3稳压输出
- 锂电池焊接端口
- 按键
- ADC检测电池电压电路
- MPU6050
- TP4056充电电路
- 电源指示灯
- 开关机电路
- Micro-USB充电口

# Board PCB1
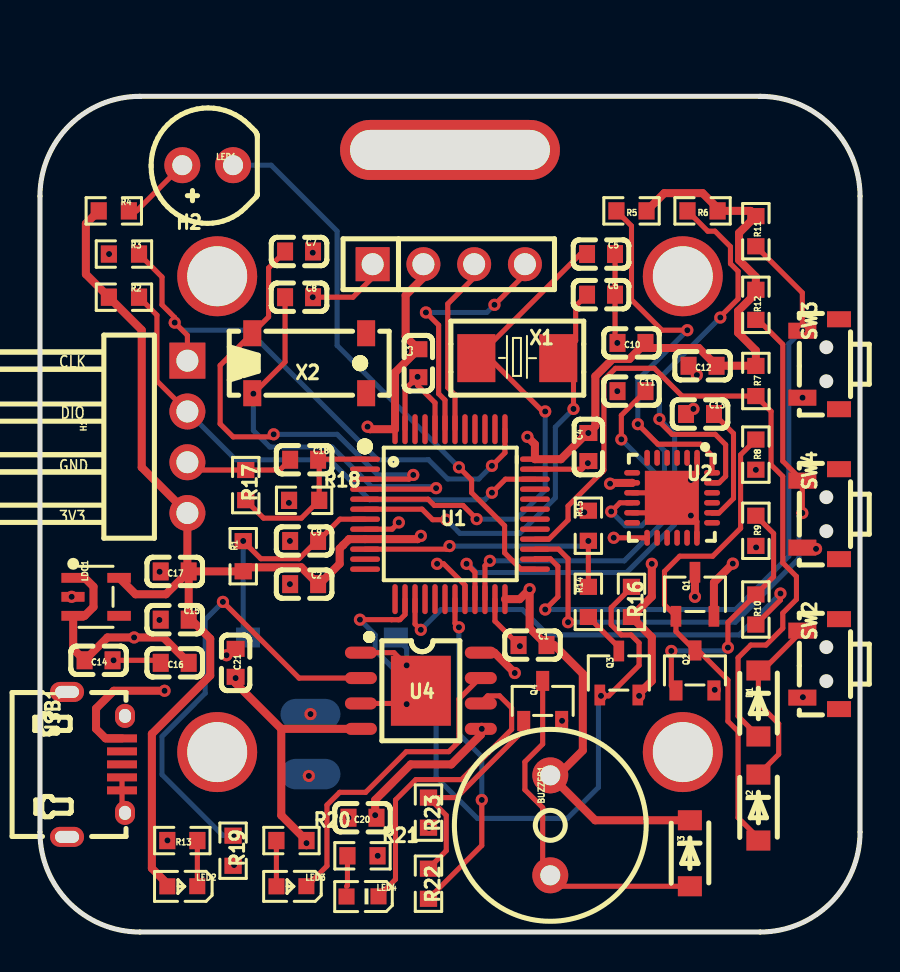
[diagram p1: board, top side]
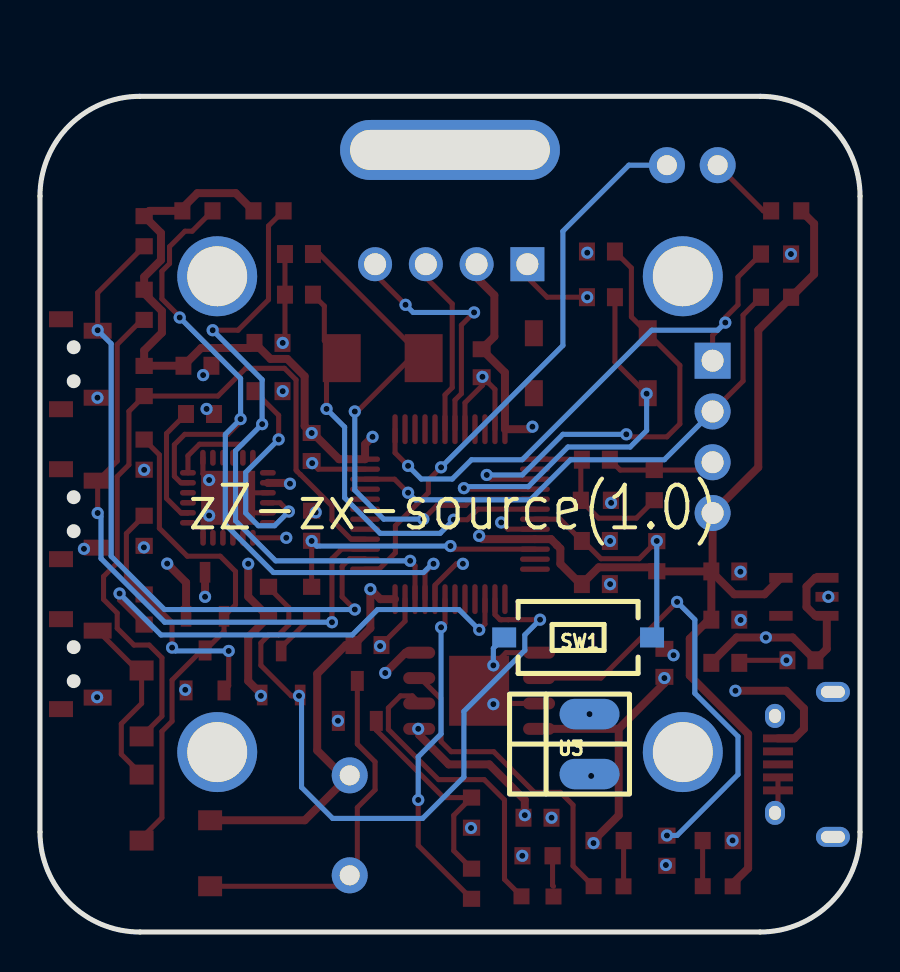
[diagram p2: board, bottom side, seen from below]

Outline 41.04 x 41.8 mm; copper layers: Top Layer, GND, PWR, Bottom Layer. Coordinates in mm from the lower left corner of the outline.
Outline path: 0,36.8 0,5 arc(1.46,1.46) 5,0 36.04,0 arc(39.58,1.46) 41.04,5 41.04,36.8 arc(39.58,40.34) 36.04,41.8 5,41.8 arc(1.46,40.34) 0,36.8
Stack: Top Layer 0.035mm 外层铜厚1oz / Dielectric1 0.2104mm 7628 RC49% 8.6mil / GND 0.0152mm 内层铜厚 / Dielectric2 1.065mm 1.1mm H/HOZ Copper / PWR 0.0152mm 内层铜厚 / Dielectric3 0.2104mm 7628 RC49% 8.6mil / Bottom Layer 0.035mm 外层铜厚1oz

## Design rules (mm)
template: JLCPCB Capability(Two Layers Board)
spacing copperThickness1oz (default): track to track 0.102, other pairs 0.152 to 0.3
spacing copperThickness2oz: track to track 0.203, other pairs 0.152 to 0.3
track width copperThickness1oz (default): min 0.127, default 0.254, max 2.54
track width copperThickness2oz: min 0.203, default 0.254, max 2.54
differential pair differentialPair (default): width min 0.127, default 0.254, max 2.54; gap min 0.152, default 0.152
via viaSize (default): diameter min 0.5, default 0.61, max 10; hole min 0.3, default 0.305, max 6.3

## Placement (name value [footprint] x y rotation side)
BUZZER1  3kHz  [BUZ-TH_BD9.6-P5.00-D0.7-FD]  25.54 5.34 270 top
C1  100nF  [C0603]  24.65 14.35 180 top
C2  100nF  [C0603]  13.22 17.4 180 top
C3  100nF  [C0603]  18.94 28.45 270 top
C4  100nF  [C0603]  27.44 24.26 270 top
C5  20pF  [C0603]  28.08 33.91 180 top
C6  20pF  [C0603]  28.08 31.88 180 top
C7  20pF  [C0603]  12.97 34.04 180 top
C8  20pF  [C0603]  12.97 31.75 180 top
C9  100nF  [C0603]  13.22 19.56 180 top
C10  10nF  [C0603]  29.6 29.47 0 top
C11  100nF  [C0603]  29.6 27.05 180 top
C12  100nF  [C0603]  33.16 28.32 0 top
C13  2.2nF  [C0603]  33.03 25.91 180 top
C14  100nF  [C0603]  2.93 13.59 0 top
C15  100nF  [C0603]  6.74 15.62 180 top
C16  1uF  [C0603]  6.74 13.46 0 top
C17  1uF  [C0603]  6.74 18.04 0 top
C18  100nF  [C0603]  13.22 23.62 180 top
C20  10uF  [C0603]  16.14 5.72 0 top
C21  10uF  [C0603]  9.79 13.46 90 top
D1  SM4007PL  [SOD-123F_L2.8-W1.8-LS3.7-RD]  35.95 11.43 270 top
D2  SM4007PL  [SOD-123F_L2.8-W1.8-LS3.7-RD]  35.95 6.22 270 top
D3  SM4007PL  [SOD-123F_L2.8-W1.8-LS3.7-RD]  32.52 3.94 270 top
H1  PZ254R-11-04P  [HDR-TH_4P-P2.54-H-M-W10.4]  7.38 24.77 270 top
H2  PM254V-11-04-H85  [HDR-TH_4P-P2.54-V-F]  20.46 33.4 0 top
LDO1  ME6211C33M5G-N  [SOT-23-5_L3.0-W1.7-P0.95-LS2.8-BL]  2.81 16.77 270 top
LED1  XL-502UWC  [LED-TH_BD5.9-P2.54-RD_WHITE]  8.39 38.36 180 top
LED2  XL-1608SURC-06  [LED0603-RD_RED]  7.12 2.29 180 top
LED3  XL-1608SURC-06  [LED0603-RD_RED]  12.59 2.29 180 top
LED4  XL-1608PGC-06  [LED0603-RD_GREEN]  16.14 1.78 180 top
NOREF  -  [Pad_e72]  8.87 32.8 0 top
NOREF#2  -  [Pad_e76]  32.17 9 0 top
NOREF#3  -  [Pad_e75]  8.87 9 0 top
NOREF#4  -  [Pad_e74]  32.17 32.8 0 top
NOREF#5  -  [Pad_e1294]  20.52 39.12 0 top
Q1  SI2301CDS-T1-GE3  [SOT-23-3_L3.0-W1.7-P0.95-LS2.9-BR]  32.78 16.89 270 top
Q2  SS8050  [SOT-23-3_L2.9-W1.3-P1.90-LS2.4-BR]  32.78 13.08 270 top
Q3  SI2301CDS-T1-GE3  [SOT-23-3_L3.0-W1.7-P0.95-LS2.9-BR]  28.97 12.96 270 top
Q4  SS8050  [SOT-23-3_L2.9-W1.3-P1.90-LS2.4-BR]  25.16 11.56 270 top
R1  10kΩ  [R0603]  10.17 18.8 270 top
R2  10kΩ  [R0603]  4.2 31.75 180 top
R3  10kΩ  [R0603]  4.2 33.91 180 top
R4  1kΩ  [R0603]  3.7 36.07 180 top
R5  10kΩ  [R0603]  29.6 36.07 0 top
R6  10kΩ  [R0603]  33.16 36.07 0 top
R7  10kΩ  [R0603]  35.83 27.56 90 top
R8  10kΩ  [R0603]  35.83 23.88 90 top
R9  10kΩ  [R0603]  35.83 20.07 90 top
R10  1kΩ  [R0603]  35.83 16.13 90 top
R11  10kΩ  [R0603]  35.83 35.05 90 top
R12  10kΩ  [R0603]  35.83 31.37 90 top
R13  1kΩ  [R0603]  7.12 4.57 0 top
R14  1kΩ  [R0603]  27.44 16.51 270 top
R15  4kΩ  [R0603]  27.44 20.32 270 top
R16  10kΩ  [R0603]  29.6 16.51 90 top
R17  10kΩ  [R0603]  10.3 22.35 90 top
R18  2kΩ  [R0603]  13.22 21.59 180 top
R19  10kΩ  [R0603]  9.66 4.07 90 top
R20  1kΩ  [R0603]  12.59 4.57 180 top
R21  1kΩ  [R0603]  16.14 3.81 180 top
R22  1kΩ  [R0603]  19.44 2.41 90 top
R23  10kΩ  [R0603]  19.44 5.97 90 top
SW1  TS-1101-C-W  [SW-SMD_L6.0-W3.3-LS8.0_TS-1101-C-W]  14.11 14.73 180 bottom
SW2  GT-TC018A-H0375-L1  [SW-SMD_L4.7-W3.5-P3.35-EH]  39.07 13.4 270 top
SW3  GT-TC018A-H0375-L1  [SW-SMD_L4.7-W3.5-P3.35-EH]  39.07 28.4 270 top
SW4  GT-TC018A-H0375-L1  [SW-SMD_L4.7-W3.5-P3.35-EH]  39.07 20.9 270 top
U1  STM32F103C8T6  [LQFP-48_L7.0-W7.0-P0.50-LS9.0-BL]  20.52 20.9 270 top
U2  MPU-6050  [QFN-24_L4.0-W4.0-P0.50-BL-EP2.7]  31.63 21.72 180 top
U3  -  [302530BAT]  17.54 9.4 180 bottom
U4  TP4056-MS  [SOP-8_L4.9-W3.9-P1.27-LS6.0-TL-EP]  19.06 12.07 0 top
USB1  U254-051T-4BH23-S2S  [MICRO-USB-SMD_U254-051T-4BH23-S2S]  2.81 8.38 270 top
X1  8MHz  [CRYSTAL-SMD_L5.0-W3.2]  23.89 28.7 180 top
X2  32.768kHz  [MC-306_4P-L8.0-W3.2-P5.5-BL]  13.47 28.45 0 top

## Footprints (pads in the part's own frame, mm; a bottom-side part is the same pattern mirrored in y, then rotated)
302530BAT
  oval 3x1.524 smd: 1(4,1.5) 2(4,-1.5)
BUZ-TH_BD9.6-P5.00-D0.7-FD
  round 1.8 hole 1: 1(-2.5,0) 2(2.5,0)
C0603
  rect 0.8x0.9 smd: 1(-0.7,0) 2(0.7,0)
CRYSTAL-SMD_L5.0-W3.2
  rect 1.9x2.4 smd: 1(-2.05,0) 2(2.05,0)
HDR-TH_4P-P2.54-H-M-W10.4
  rect 1.8x1.8 hole 1.1: 1(-3.81,0)
  round 1.8 hole 1.1: 2(-1.27,0) 3(1.27,0) 4(3.81,0)
HDR-TH_4P-P2.54-V-F
  rect 1.7x1.7 hole 1.1: 1(-3.81,0)
  round 1.7 hole 1.1: 2(-1.27,0) 3(1.27,0) 4(3.81,0)
LED0603-RD_GREEN
  rect 0.8x0.8 smd: 1(-0.799,-0.004) 2(0.799,0.004)
LED0603-RD_RED
  rect 0.8x0.8 smd: 1(-0.749,-0.004) 2(0.749,0.004)
LED-TH_BD5.9-P2.54-RD_WHITE
  round 1.8 hole 1: 1(-1.27,0) 2(1.27,0)
LQFP-48_L7.0-W7.0-P0.50-LS9.0-BL
  oval 0.27x1.5 smd: 1(-2.75,-4.25) 2(-2.25,-4.25) 3(-1.75,-4.25) 4(-1.25,-4.25) 5(-0.75,-4.25) 6(-0.25,-4.25) 7(0.25,-4.25) 8(0.75,-4.25) 9(1.25,-4.25) 10(1.75,-4.25) 11(2.25,-4.25) 12(2.75,-4.25) 25(2.75,4.25) 26(2.25,4.25) 27(1.75,4.25) 28(1.25,4.25) 29(0.75,4.25) 30(0.25,4.25) 31(-0.25,4.25) 32(-0.75,4.25) 33(-1.25,4.25) 34(-1.75,4.25) 35(-2.25,4.25) 36(-2.75,4.25)
  oval 1.5x0.27 smd: 13(4.25,-2.75) 14(4.25,-2.25) 15(4.25,-1.75) 16(4.25,-1.25) 17(4.25,-0.75) 18(4.25,-0.25) 19(4.25,0.25) 20(4.25,0.75) 21(4.25,1.25) 22(4.25,1.75) 23(4.25,2.25) 24(4.25,2.75) 37(-4.25,2.75) 38(-4.25,2.25) 39(-4.25,1.75) 40(-4.25,1.25) 41(-4.25,0.75) 42(-4.25,0.25) 43(-4.25,-0.25) 44(-4.25,-0.75) 45(-4.25,-1.25) 46(-4.25,-1.75) 47(-4.25,-2.25) 48(-4.25,-2.75)
MC-306_4P-L8.0-W3.2-P5.5-BL
  rect 0.9x1.3 smd: 1(-2.85,-1.5) 2(2.85,-1.5) 3(2.85,1.5) 4(-2.85,1.5)
MICRO-USB-SMD_U254-051T-4BH23-S2S
  rect 0.4x1.5 smd: 1(-1.3,1.3) 2(-0.65,1.3) 3(0,1.3) 4(0.65,1.3) 5(1.3,1.3)
  oval 1x1.7 hole 0.6x1.2: 6(-3.624,-1.45) 6(3.624,-1.45)
  oval 1.2x1 hole 0.7x0.6: 6(-2.425,1.45) 6(2.425,1.45)
Pad_e72
  round 4 hole 3: 1(0,0)
Pad_e74
  round 4 hole 3: 1(0,0)
Pad_e75
  round 4 hole 3: 1(0,0)
Pad_e76
  round 4 hole 3: 1(0,0)
Pad_e1294
  oval 11x3 hole 10x2: 1(0,0)
QFN-24_L4.0-W4.0-P0.50-BL-EP2.7
  oval 0.28x0.8 smd: 1(-1.25,-2) 2(-0.75,-2) 3(-0.25,-2) 4(0.25,-2) 5(0.75,-2) 6(1.25,-2) 13(1.25,2) 14(0.75,2) 15(0.25,2) 16(-0.25,2) 17(-0.75,2) 18(-1.242,2)
  oval 0.8x0.28 smd: 7(2,-1.25) 8(2,-0.75) 9(2,-0.25) 10(2,0.25) 11(2,0.75) 12(2,1.25) 19(-2,1.25) 20(-2,0.75) 21(-2,0.25) 22(-2,-0.25) 23(-2,-0.75) 24(-2,-1.25)
  rect 2.7x2.7 smd: 25(0.013,0)
R0603
  rect 0.806x0.864 smd: 1(-0.753,0) 2(0.753,0)
SOD-123F_L2.8-W1.8-LS3.7-RD
  rect 1x1.2 smd: 1(-1.65,0) 2(1.65,0)
SOP-8_L4.9-W3.9-P1.27-LS6.0-TL-EP
  oval 1.6x0.6 smd: 1(-3,1.905) 2(-3,0.635) 3(-3,-0.635) 4(-3,-1.905) 5(3,-1.905) 6(3,-0.635) 7(3,0.635) 8(3,1.905)
  rect 3x3.5 smd: 9(0,0)
SOT-23-3_L2.9-W1.3-P1.90-LS2.4-BR
  rect 1x0.65 smd: 1(1,-0.95) 2(1,0.95) 3(-1,0)
SOT-23-3_L3.0-W1.7-P0.95-LS2.9-BR
  rect 1.038x0.532 smd: 1(1.101,-0.95) 2(1.101,0.95) 3(-1.101,0)
SOT-23-5_L3.0-W1.7-P0.95-LS2.8-BL
  rect 0.49x1.157 smd: 1(-0.95,-1.153) 2(0,-1.153) 3(0.95,-1.153)
  rect 0.49x1.175 smd: 4(0.95,1.153) 5(-0.95,1.153)
SW-SMD_L4.7-W3.5-P3.35-EH
  rect 0.8x1.4 smd: 1(-1.675,-0.917) 2(1.675,-0.917)
  rect 0.8x1.2 smd: 3(-2.25,0.917) 4(2.25,0.917)
SW-SMD_L6.0-W3.3-LS8.0_TS-1101-C-W
  rect 1.2x1 smd: 1(-3.7,0) 2(3.7,0)

## Nets
As in the schematic.

Pads without a net: LDO1 4; NOREF 1; NOREF#2 1; NOREF#3 1; NOREF#4 1; NOREF#5 1; SW2 3 4; SW3 3 4; SW4 3 4; U1 2 11 12 13 16 17 18 29 30 31 32 33 38 39 40 41 45 46; U2 2 3 4 5 6 7 12 14 15 16 17 19 21 22; USB1 2 3; X2 2 3

## Via types
v1: diameter 0.61, hole 0.305, Top Layer to Bottom Layer, 96 vias

## Routing (per net, layer and track width the routed paths; a pad name or vN(x,y) marks a point on that pad's centre or on a via; arc(x,y) is an arc through that point)
3V3: length 150.8
  Top Layer w0.254: U2.13 v1(28.71,19.72)
  Top Layer w0.4: v1(28.53,22.42) 28.57,22.46 29.63,22.46 U2.8 ; v1(24.4,24.77) 24.77,24.39 U1.36 26.07,23.65 27.38,24.96 v1(27.44,24.96) 27.8,25.31 27.8,27.8 28.66,28.66 29.5,28.66 C10.2 30.56,29.21 32.97,29.21 C12.2 35.82,28.32 R7.2 35.83,29.08 34.94,29.97 34.94,31.06 35.83,31.95 R12.2 35.83,32.77 34.99,33.61 34.99,34.97 R11.2 35.56,36.07 R6.2 33.91,36.21 33.16,36.96 31.25,36.96 R5.2 ; 7.44,18.04 6.3,16.89 4.78,16.89 LDO1.5 ; 7.44,18.04 7.44,15.62 7.57,15.62 8.52,14.67 8.52,12.83 5.6,9.91 5.6,3.19 6.38,2.41 LED2.2 ; 7.44,18.04 7.38,18.1 H1.4 5.09,23.24 5.09,30.11 R2.2 2.3,32.9 2.3,35.43 R4.2 ; 7.44,18.04 10.16,18.04 R1.2 10.37,18.24 13.08,18.24 C2.1 13.98,17.4 15,18.42 15,19.18 15.17,19.35 15.17,19.35 15.45,19.64 15.46,19.64 15.47,19.65 U1.9 18.9,19.65 v1(19.06,19.81) ; D3.1 27.79,5.59 BUZZER1.1 25.92,7.84 27.17,9.08 27.17,12.92 25.73,14.35 C1.1 24.5,15.2 v1(24.5,17.15) 24.01,16.65 U1.24 ; H2.2 19.19,32.74 18.3,31.85 18.3,29.78 C3.1 17.77,27.98 U1.48 16.52,25.15 v1(16.4,25.27)
  PWR w0.4: v1(27.44,24.96) 28.53,23.87 v1(28.53,22.42) 28.33,22.42 27.93,22.02 27.93,20.5 v1(28.71,19.72) ; 24.52,17.15 24.52,24.64 v1(24.4,24.77) ; 24.52,17.15 24.02,17.66 19.7,17.66 18.81,18.54 18.81,19.56 v1(19.06,19.81) 18.94,19.94 18.94,21.68 16.4,24.22 v1(16.4,25.27) ; 24.52,17.15 v1(24.5,17.15)
+5V: length 58.9
  Top Layer w0.4: U4.4 12.08,10.16 ; 12.08,10.16 9.79,12.45 v1(9.79,12.7) ; 12.08,10.16 12.08,5.84 R20.1 v1(13.34,4.45) ; U4.8 22.75,13.97 v1(23.76,12.96) ; v1(6.24,12.07) 3.7,12.07 2.81,11.18 2.81,10.16 3.28,9.68 USB1.1
  PWR w0.4: v1(13.34,4.45) 16.27,4.45 v1(16.9,3.81) ; v1(6.24,12.07) 9.16,12.07 v1(9.79,12.7) 11.19,14.1 11.19,22.23 12.46,23.5 14.62,23.5 16.52,21.59 16.52,19.56 19.57,16.51 20.77,16.51 23.76,13.52 v1(23.76,12.96)
GND: length 47.5
  Top Layer w0.254: C18.2 12,23.11 R17.2 7.77,23.11 H1.3 ; v1(17.96,20.48) 17.62,20.15 U1.8 ; U1.23 22.77,15.55 v1(24.02,14.3) ; USB1.6 4.11,6.11 USB1.5 USB1.4 ; U2.1 32.88,22.92 v1(32.58,22.61) ; C5.1 C6.1 28.78,29.58 v1(28.89,29.47) ; U4.1 17.72,13.97 v1(18.35,13.34) ; U4.3 18.32,11.43 v1(18.35,11.4) ; v1(32.58,20.83) 32.88,20.53 32.88,19.72 ; v1(19.88,18.42) 20.2,18.42 21.27,17.35 U1.20 ; U1.44 19.77,26.47 18.9,27.34 v1(18.9,27.77) 18.27,27.14 U1.47 ; v1(3.68,13.59) 5.92,13.59 C16.1 ; H2.1 16.65,32.74 15.66,31.75 C8.1 ; v1(27.42,23.45) 27.12,23.15 U1.35 ; U2.11 30.87,20.97 U2.25 31.37,21.97 U2.9
  Bottom Layer w0.254: v1(18.35,13.34) 18.35,14.19 SW1.1
  vias: v1(1.59,16.77) v1(3.46,33.91) v1(5.99,18.02) v1(5.98,15.61) v1(6.38,4.58) v1(9.33,13.84) v1(9.72,3.35) v1(12.51,19.56) v1(12.51,17.4) v1(13.46,7.81) v1(13.65,33.98) v1(13.65,31.75) v1(15.44,5.72) v1(19.47,5.2) v1(26.13,10.56) v1(27.24,20.99) v1(28.89,27.05) v1(32.7,26.16) v1(32.88,27.86) v1(33.77,12.11) v1(35.84,19.24) v1(38.16,26.73) v1(38.18,11.75) v1(38.84,19.16)
VBAT: length 59.8
  Top Layer w0.4: 7.44,13.53 7.44,13.46 6.17,14.73 v1(4.71,14.73) 3.38,14.73 C14.1 1.66,14.16 1.66,15.81 LDO1.3 2.24,15.82 2.68,16.26 2.68,17.27 2.24,17.72 LDO1.1 ; v1(32.78,16.77) Q1.3
  PWR w0.4: v1(32.78,16.77) 31.63,16.77 26.43,11.56 21.86,11.56 18.17,7.88 18.17,3.3 17.03,2.16 9.79,2.16 5.36,6.59 5.36,14.08 v1(4.71,14.73)
VBAT+: length 54
  Top Layer w0.4: Q3.2 30.62,12.56 30.62,14.74 R16.1 30.62,16.77 v1(30.62,18.42) ; v1(22.11,10.16) U4.5 22.06,9.86 20.59,8.38 18.55,8.38 16.78,6.61 v1(16.78,5.84) ; v1(34.67,18.43) 33.73,17.48 Q1.2
  PWR w0.4: v1(29.98,11.81) 29.35,11.81 27.3,9.76 22.51,9.76 v1(22.11,10.16) ; v1(35.83,23.12) 34.67,21.96 v1(34.67,18.43) 30.63,18.43 v1(30.62,18.42) ; v1(16.78,5.84) 16.78,6.61 13.54,9.84 v1(13.54,10.9) 13.54,20.38 v1(12.46,21.47)
ADC: length 13.6
  Top Layer w0.254: v1(20.5,19.31) 20.34,19.15 U1.10 ; R15.2 R14.1
  Bottom Layer w0.254: v1(27.44,19.56) 27.19,19.31 v1(20.5,19.31)
BAT_ADC_EN: length 34.6
  Top Layer w0.254: U1.14 18.27,15.88 18.02,15.62 17.94,15.62 17.94,15.62 17.6,15.62 17.6,15.62 v1(16.01,15.62) ; R16.2 29.48,17.14 29.48,17.12 28.59,16.23 28.59,15.37 29.09,14.86 29.58,14.86 29.98,14.46 29.98,13.34 28.46,11.81 v1(28.08,11.81)
  Bottom Layer w0.254: v1(28.08,11.81) 27.95,11.69 27.95,7.24 26.39,5.68 21.89,5.68 19.82,7.75 19.82,11.04 16.78,14.09 16.78,14.86 v1(16.01,15.62)
BUZZER: length 16.6
  Top Layer w0.254: v1(20.97,15.24) 20.77,15.44 U1.19 ; R22.1 22.11,4.33 v1(22.11,6.61)
  Bottom Layer w0.254: v1(20.97,15.24) 20.97,9.91 22.11,8.77 v1(22.11,6.61)
CTL: length 23.5
  Top Layer w0.254: U1.15 18.77,15.4 v1(19.06,15.11) ; v1(37.06,16.93) 37.06,16.61 R10.1
  Bottom Layer w0.254: v1(19.06,15.11) 20.07,16.13 24.14,16.13 25.41,14.86 34.99,14.86 v1(37.06,16.93)
I2C1_SCL: length 9
  Top Layer w0.254: H2.3 21.73,32.74 20.41,31.42 20.41,27.23 20.77,26.87 U1.42
I2C1_SDA: length 12.5
  Top Layer w0.254: U1.43 20.27,26.61 19.95,26.93 19.95,30.36 v1(19.32,30.99) ; H2.4 24.27,32.89 v1(22.75,31.37)
  Bottom Layer w0.254: v1(19.32,30.99) 22.36,30.99 v1(22.75,31.37)
I2C2_SCL: length 38.7
  Top Layer w0.254: v1(31,25.66) 31,25.53 31.63,24.89 33.79,24.89 34.31,24.37 34.31,22.8 33.99,22.47 U2.23 ; U1.21 21.77,17.99 v1(21.35,18.42) ; v1(34.05,30.74) 34.05,30.78 34.94,31.67 34.94,33.05 34.56,33.43 34.56,34.28 33.78,35.05 33.42,35.05 R6.1
  Bottom Layer w0.254: v1(21.35,18.42) 21.41,18.42 21.85,17.98 29.36,17.98 31.76,20.39 31.76,24.89 v1(31,25.66) 31,27.69 v1(34.05,30.74)
I2C2_SDA: length 36.1
  Top Layer w0.254: U2.24 33.63,23.82 33.06,24.4 30.93,24.4 v1(29.92,25.4) ; U1.22 22.27,18.32 v1(22.52,18.57) ; R5.1 29.6,35.32 29.6,31.62 31.13,30.1 v1(32.4,30.1)
  Bottom Layer w0.254: v1(22.52,18.57) 29.24,18.57 31.25,20.58 31.25,24.07 v1(29.92,25.4) 29.92,27.62 v1(32.4,30.1)
KEY1: length 33.8
  Top Layer w0.254: R11.1 38.15,31.97 38.15,30.08 ; U1.26 24.79,18.67 25.54,18.67 25.92,18.29 25.92,16.77 v1(25.28,16.13)
  Bottom Layer w0.254: v1(25.28,16.13) 34.81,16.13 37.48,18.8 37.48,29.43 v1(38.15,30.1)
KEY2: length 30.9
  Top Layer w0.254: v1(38.15,20.96) 38.15,22.58 37.17,23.55 37.17,29.39 35.94,30.62 R12.1 ; v1(26.43,15.5) 26.43,18.67 25.95,19.15 U1.27
  Bottom Layer w0.254: v1(26.43,15.5) 34.8,15.5 37.99,18.69 37.99,20.79 v1(38.15,20.96)
KEY3: length 38.2
  Top Layer w0.254: U1.28 25.47,19.65 26.43,20.61 26.43,21.31 28,22.88 28.01,22.88 28.17,23.04 28.17,23.05 28.22,23.1 28.22,27.62 28.8,28.2 30.75,28.2 32.13,26.81 R7.1 36.59,26.05 36.59,23.37 37.17,22.78 37.17,18.47 37.86,17.78 37.86,16.64 37.17,15.95 37.17,15.19 36.33,14.35 35.57,14.35 34.94,13.72 34.94,10.8 D1.2
LED: length 28
  Top Layer w0.254: U1.25 24.07,18.15 23.25,18.97 23.25,20.32 21.6,21.97 21.6,22.61 v1(20.97,23.24)
  Bottom Layer w0.254: v1(20.97,23.24) 14.87,29.34 14.87,35.05 11.57,38.36 LED1.1
NRST: length 12.2
  Top Layer w0.254: U1.7 15.01,20.65 C9.1 13.86,19.56 12.97,18.67 11.05,18.67 R1.1
  Bottom Layer w0.254: SW1.2 10.17,14.97 v1(10.17,19.56)
OSC32_IN: length 23.3
  Top Layer w0.254: v1(11.7,24.89) 11.57,24.77 9.66,24.77 9.02,25.41 9.02,28.34 X2.4 11.44,30.77 11.44,33.21 C7.2 ; v1(18.68,22.86) 18.47,22.65 U1.3
  Bottom Layer w0.254: v1(11.7,24.89) 14.87,24.89 16.9,22.86 v1(18.68,22.86)
OSC32_OUT: length 21.2
  Top Layer w0.254: U1.4 19.77,22.15 v1(19.82,22.2) ; v1(10.68,26.93) 12.27,28.51 C8.2
  Bottom Layer w0.254: v1(10.68,26.93) 10.68,25.08 11.5,24.26 14.62,24.26 16.6,22.28 19.75,22.28 v1(19.82,22.2)
OSC_IN: length 26.2
  Top Layer w0.254: C5.2 27.05,33.91 X1.2 22.49,28.7 25.16,26.04 v1(25.28,26.04) ; U1.5 19.42,21.65 19.73,21.34 21.17,21.34 v1(21.86,20.65)
  Bottom Layer w0.254: v1(21.86,20.65) 23.84,20.65 25.28,22.1 v1(25.28,26.04)
OSC_OUT: length 22.2
  Top Layer w0.254: v1(20.33,20.62) 19.65,20.62 19.12,21.15 U1.6 ; C6.2 26.81,31.31 26.81,29.58 X1.1 26.7,27.94 v1(26.7,26.16)
  Bottom Layer w0.254: v1(26.7,26.16) 25.79,25.26 25.79,21.72 24.02,19.94 21.01,19.94 v1(20.33,20.62)
SWCLK: length 27.8
  Top Layer w0.254: H1.1 7.38,29.85 v1(6.74,30.48) 6.74,30.74 6.11,31.37 6.11,32.76 R3.1 ; v1(22.62,23.32) 23.27,23.97 U1.37
  Bottom Layer w0.254: v1(6.74,30.48) 7.12,30.1 10.43,30.1 16.9,23.62 19.44,23.62 20.41,22.66 21.96,22.66 v1(22.62,23.32)
SWDIO: length 26.4
  Top Layer w0.254: H1.2 5.85,27.56 5.85,30.85 R2.1 ; U1.34 23.3,22.65 v1(22.62,21.97)
  Bottom Layer w0.254: H1.2 9.79,23.62 14.49,23.62 16.5,21.62 22.26,21.62 v1(22.62,21.97)
$1N2713: length 3.6
  Top Layer w0.254: LED1.2 4.84,36.07 R4.1
$1N4061: length 11.2
  Top Layer w0.254: C11.1 29.09,25.84 v1(29.09,24.64) ; v1(28.59,21.03) 29.02,21.47 U2.10
  Bottom Layer w0.254: v1(29.09,24.64) 30.75,22.99 30.75,20.96 30.11,20.32 29.3,20.32 v1(28.59,21.03)
$1N4275: length 6
  Top Layer w0.254: C13.1 34.71,24.93 34.71,21.69 33.98,20.96 33.65,20.96 U2.20
$1N5916: length 9.1
  Top Layer w0.254: D2.1 36.97,8.89 36.97,10.42 35.95,11.43 D1.1 36.16,13.08 38.15,15.08
$1N5939: length 25
  Top Layer w0.254: 35.95,4.58 35.95,4.7 34.94,5.72 34.94,10.03 34.43,10.54 34.43,12.6 32.95,14.08 Q2.3 31.83,15.03 Q1.1 31.25,16.37 31.25,18.04 32.02,18.8 33.67,18.8 35.06,20.19 35.06,23.87 R8.2
$1N6231: length 12.9
  Top Layer w0.254: Q2.1 31.59,12.32 v1(31.59,14.06) ; v1(34.43,14.23) 34.43,15.49 R10.2 36.72,17.77 36.72,19.93 R9.2
  Bottom Layer w0.254: v1(34.43,14.23) 34.26,14.06 v1(31.59,14.06)
$1N7170: length 2.3
  Top Layer w0.254: LED2.1 7.88,2.3 R13.2
$1N7264: length 2.3
  Top Layer w0.254: Q3.3 28.97,14.23 R14.2
$1N7605: length 8.8
  Top Layer w0.254: R17.1 10.3,21.59 11.19,20.7 13.08,20.7 R18.1 13.97,23.57 C18.1 13.95,23.65 U1.1
$1N8107: length 23.2
  Top Layer w0.254: U4.2 12.97,12.7 v1(9.16,16.51)
  Bottom Layer w0.254: v1(9.16,16.51) 8.27,15.62 8.27,11.94 6.11,9.78 6.11,7.88 9.16,4.83 v1(9.66,4.83)
$1N8262: length 16.1
  Top Layer w0.254: LED3.1 13.35,2.29 14.36,3.3 14.36,6.35 15,6.99 16.3,6.99 18.33,9.02 20.46,9.02 20.97,9.53 20.97,11.66 22.01,12.7 U4.7
$1N8264: length 2.3
  Top Layer w0.254: LED3.2 11.83,2.29 R20.2
$1N8386: length 15.5
  Top Layer w0.254: U4.6 22.06,11.47 22.4,11.81 23,11.81 23.6,11.21 23.6,10.13 21.09,7.62 18.81,7.62 17.79,6.61 17.79,2.63 LED4.1
$1N8609: length 1.5
  Top Layer w0.254: R21.2 15.39,2.33 15.34,2.28
$1N8968: length 17.8
  Top Layer w0.254: Q4.3 25.16,9.4 24.27,8.51 24.27,7.11 25.16,6.22 25.16,3.22 BUZZER1.2 26.09,2.29 D3.2
$1N9028: length 10.9
  Top Layer w0.254: Q4.1 24.21,10.1 20.84,6.72 R23.2 20.33,5.84 20.33,4.07 19.44,3.18 R22.2

## Copper pours and planes (outline as drawn; the poured copper is in the pictures)
GND on GND: 0.26,41.54 40.78,41.54 40.78,0.26 0.26,0.26

Small or netless copper shapes (teardrops, artwork), in the pictures only: 22 on GND

## Text on the board
Bottom Silkscreen Layer: zZ-zx-source(1.0)
Top Silkscreen Layer: CLK | GND | 3V3 | DIO
